# EasyEDA Pro project AFE-30P.epro, board PCB1_1
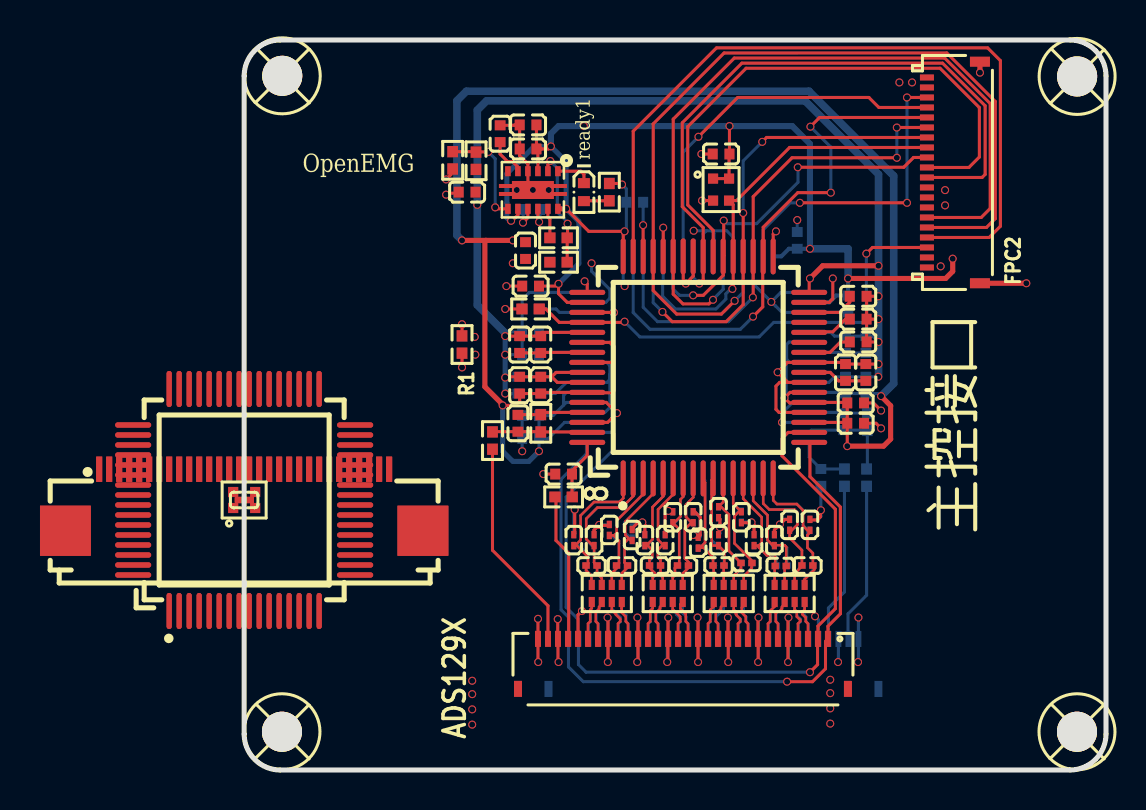
[diagram p0: board, top side]
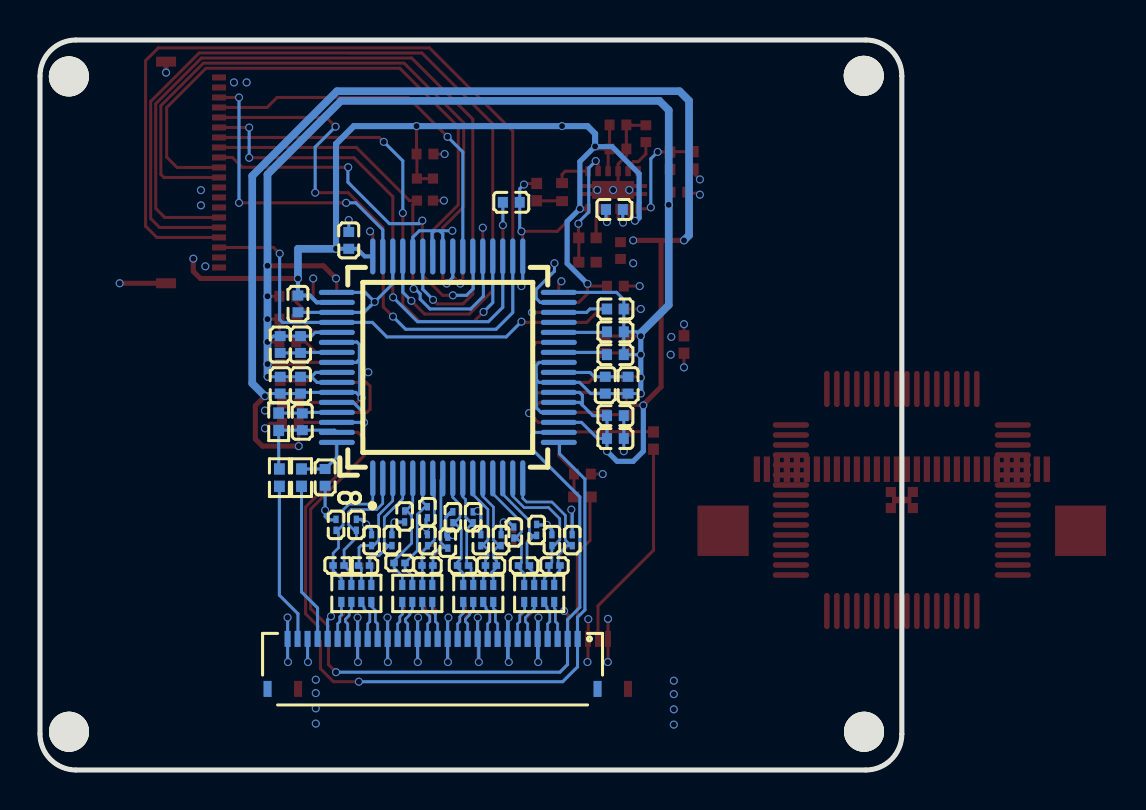
[diagram p1: board, bottom side, seen from below]

Outline 43.1 x 36.5 mm; copper layers: Top Layer, Inner1, Inner2, Bottom Layer. Coordinates in mm from the lower left corner of the outline.
Outline path: 0,34.7 0,1.8 arc(0.53,0.53) 1.8,0 41.3,0 arc(42.57,0.53) 43.1,1.8 43.1,34.7 arc(42.57,35.97) 41.3,36.5 1.8,36.5 arc(0.53,35.97) 0,34.7
Stack: Top Layer 0.035mm Outer layer thickness 1oz / Dielectric1 0.1mm 3313 RC57% 4.0mil / Inner1 0.0152mm Inner layer thickness / Dielectric2 0.5mm 0.5mm H/HOZ Copper / Inner2 0.0152mm Inner layer thickness / Dielectric3 0.1mm 3313 RC57% 4.0mil / Bottom Layer 0.035mm Outer layer thickness 1oz

## Design rules (mm)
net IN8N: DP1
net IN8P: DP1
net IN7N: DP2
net IN7P: DP2
net IN6N: DP3
net IN6P: DP3
net IN5N: DP4
net IN5P: DP4
net IN4N: DP5
net IN4P: DP5
net IN3N: DP6
net IN3P: DP6
net IN2P: DP7
net IN2N: DP7
net IN1N: DP8
net IN1P: DP8
net IN1P2: DP35
net IN1N2: DP35
net IN2P2: DP37
net IN2N2: DP37
net IN3P2: DP33
net IN3N2: DP33
net IN4P2: DP31
net IN4N2: DP31
net IN5P2: DP29
net IN5N2: DP29
net IN6P2: DP27
net IN6N2: DP27
net IN7P2: DP25
net IN7N2: DP25
net IN8P2: DP23
net IN8N2: DP23
spacing copperThickness1oz (default): track to track 0.102, other pairs 0.152 to 0.3
spacing copperThickness2oz: track to track 0.203, other pairs 0.152 to 0.3
spacing Copper_copperRegion: track to track 0.102, other pairs 0.152 to 0.3
spacing Plane_innerPlane: track to track 0.102, other pairs 0.152 to 0.3
track width copperThickness1oz (default): min 0.127, default 0.152, max 2.54
track width copperThickness2oz: min 0.203, default 0.254, max 2.54
differential pair differentialPair (default): width min 0.127, default 0.127, max 2.54; gap min 0.152, default 0.152
net +3.3V uses copperRegion_copperThickness1oz
net AGND uses copperRegion_copperThickness1oz
net -2.5V uses copperRegion_copperThickness1oz
net +2.5V uses copperRegion_copperThickness1oz
net GND uses copperRegion_copperThickness1oz
pour e1164 uses Copper_copperRegion, copperRegion_Copper_copperRegion
pour e1166 uses Copper_copperRegion, copperRegion_Copper_copperRegion
pour e1169 uses Copper_copperRegion, copperRegion_Copper_copperRegion
pour e1171 uses Copper_copperRegion, copperRegion_Copper_copperRegion
pour e1173 uses Copper_copperRegion, copperRegion_Copper_copperRegion
pour e1175 uses Copper_copperRegion, copperRegion_Copper_copperRegion
pour e1177 uses Copper_copperRegion, copperRegion_Copper_copperRegion
pour e1179 uses Copper_copperRegion, copperRegion_Copper_copperRegion
pour e1181 uses Copper_copperRegion, copperRegion_Copper_copperRegion
pour e1678 uses Copper_copperRegion, copperRegion_Copper_copperRegion
pour e1686 uses Copper_copperRegion, copperRegion_Copper_copperRegion
pour e1905 uses Copper_copperRegion, copperRegion_Copper_copperRegion
pour e1908 uses Copper_copperRegion, copperRegion_Copper_copperRegion
pour e1930 uses Copper_copperRegion, copperRegion_Copper_copperRegion

## Placement (name value [footprint] x y rotation side)
C1  22uF  [C0402]  30.71 22.54 0 top
C2  22uF  [C0402]  14.32 21.91 180 bottom
C3  100nF  [C0402]  31.09 19.88 270 top
C4  10uF  [C0402]  30.07 19.88 270 top
C5  100nF  [C0402]  13.69 19.24 90 bottom
C6  2.2uF  [C0402]  14.07 25.97 270 top
C7  2.2uF  [C0402]  11.15 28.89 180 top
C8  100nF  [C0402]  14.2 32.25 0 top
C9  10uF  [C0402]  14.2 31.05 180 top
C10  1uF  [C0402]  14.38 28.03 180 bottom
C11  4.7uF  [C0402]  12.8 31.81 270 top
C12  1uF  [C0402]  30.71 21.4 0 top
C13  1uF  [C0402]  30.71 23.69 0 top
C14  10nF  [C0402]  13.69 17.34 270 top
C15  1uF  [C0402]  14.32 20.77 180 bottom
C16  1uF  [C0402]  14.32 23.05 180 bottom
C17  10nF  [C0402]  29.98 17.41 270 bottom
C18  100nF  [C0402]  30.07 21.27 270 bottom
C19  1uF  [C0402]  31.09 21.27 270 bottom
C20  1uF  [C0402]  13.78 21.27 270 top
C21  100nF  [C0402]  14.83 21.27 270 top
C22  100nF  [C0402]  14.32 24.19 180 top
C23  1uF  [C0402]  19.53 28.39 0 bottom
C24  100nF  [C0402]  30.58 17.34 0 top
C25  1uF  [C0402]  30.58 18.35 0 top
C26  100nF  [C0402]  14.83 19.24 90 top
C27  1uF  [C0402]  13.78 19.24 90 top
C28  100nF  [C0402]  27.66 26.48 90 bottom
C29  1uF  [C0402]  30.2 23.31 270 bottom
C30  100nF  [C0402]  14.32 16.57 180 bottom
C31  1uF  [C0402]  14.32 17.72 180 bottom
C32  100nF  [C0402]  30.07 19.24 90 bottom
C33  1uF  [C0402]  31.09 19.24 90 bottom
C34  10uF  [C0402]  14.83 19.24 90 bottom
C37  100nF  [C0402]  23.85 30.8 0 top
C55  470pF  [C0201]  28.29 12.26 270 top
C57  470pF  [C0201]  27.28 12.26 270 top
C58  470pF  [C0201]  26.52 11.49 270 top
C59  470pF  [C0201]  25.5 11.49 270 top
C60  470pF  [C0201]  24.87 12.64 90 top
C61  470pF  [C0201]  23.72 12.89 90 top
C62  470pF  [C0201]  23.72 11.49 270 top
C63  470pF  [C0201]  22.71 11.37 270 top
C64  470pF  [C0201]  22.45 12.64 270 top
C65  470pF  [C0201]  21.44 12.64 270 top
C66  470pF  [C0201]  21.06 11.49 270 top
C67  470pF  [C0201]  20.04 11.49 270 top
C68  470pF  [C0201]  19.4 11.75 270 top
C69  470pF  [C0201]  18.26 12 270 top
C70  470pF  [C0201]  17.5 11.49 270 top
C71  470pF  [C0201]  16.48 11.49 270 top
C72  22pF  [C0201#2]  28.17 10.22 0 top
C73  22pF  [C0201#2]  26.83 10.2 0 top
C74  22pF  [C0201#2]  25.12 10.35 0 top
C75  22pF  [C0201#2]  23.72 10.22 0 top
C76  22pF  [C0201#2]  21.94 10.22 0 top
C77  22pF  [C0201#2]  20.55 10.22 0 top
C78  22pF  [C0201#2]  18.9 10.22 0 top
C79  22pF  [C0201#2]  17.37 10.22 0 top
C93  470pF  [C0201]  16.48 11.49 270 bottom
C94  470pF  [C0201]  17.5 11.49 270 bottom
C95  470pF  [C0201]  18.26 12 270 bottom
C96  470pF  [C0201]  19.4 11.88 270 bottom
C97  470pF  [C0201]  20.04 11.49 270 bottom
C98  470pF  [C0201]  21.06 11.49 270 bottom
C99  470pF  [C0201]  21.44 12.64 270 bottom
C100  470pF  [C0201]  22.45 12.64 270 bottom
C101  470pF  [C0201]  22.71 11.37 270 bottom
C102  470pF  [C0201]  23.72 11.49 270 bottom
C103  470pF  [C0201]  23.72 12.89 90 bottom
C104  470pF  [C0201]  24.87 12.68 90 bottom
C105  470pF  [C0201]  25.5 11.49 270 bottom
C106  470pF  [C0201]  26.52 11.49 270 bottom
C107  470pF  [C0201]  27.28 12.26 270 bottom
C108  470pF  [C0201]  28.29 12.26 270 bottom
C109  22pF  [C0201#2]  17.37 10.22 180 bottom
C110  22pF  [C0201#2]  18.9 10.22 180 bottom
C111  22pF  [C0201#2]  20.55 10.22 180 bottom
C112  22pF  [C0201#2]  21.94 10.22 180 bottom
C113  22pF  [C0201#2]  23.72 10.22 180 bottom
C114  22pF  [C0201#2]  25.12 10.35 180 bottom
C115  22pF  [C0201#2]  26.9 10.22 180 bottom
C116  22pF  [C0201#2]  28.17 10.22 180 bottom
C123  100pF  [C0402]  15.98 14.8 180 top
C124  100pF  [C0402]  28.84 14.63 270 bottom
FPC1  FH34SRJ-30S-0.5SH(50)  [FPC-SMD_30P-P0.50_XUNPU_FPC-05F-30PH20]  21.94 5.31 0 top
FPC2  5034802000  [FPC-SMD_5034802000]  35.47 29.88 90 top
FPC3  FH34SRJ-30S-0.5SH(50)  [FPC-SMD_30P-P0.50_XUNPU_FPC-05F-30PH20]  23.47 5.31 180 bottom
LM1  LM27762DSSR  [WSON-12_L3.0-W2.0-P0.50-BL-EP]  14.44 29 180 top
NOREF  -  [Pad_e190]  5.55 12.75 0 top
NOREF#2  -  [Pad_e171]  -0.75 19.05 0 top
NOREF#3  -  [Pad_e186]  5.55 14.75 0 top
NOREF#4  -  [Pad_e83]  -7.25 15.04 0 top
NOREF#5  -  [Pad_e22]  -0.27 13.5 0 top
NOREF#6  -  [Pad_e18]  -0.55 13.9 0 top
NOREF#7  -  [Pad_e196]  5.55 9.75 0 top
NOREF#8  -  [Pad_e155]  -5.55 12.75 0 top
NOREF#9  -  [Pad_e162]  -5.55 16.25 0 top
NOREF#10  -  [Pad_e66]  1.25 15.04 0 top
NOREF#11  -  [Pad_e59]  4.75 15.04 0 top
NOREF#12  -  [Pad_e77]  -4.25 15.04 0 top
NOREF#13  -  [Pad_e22]  -0.27 13.5 0 top
NOREF#14  -  [Pad_e82]  -6.75 15.04 0 top
NOREF#15  -  [Pad_e57]  5.75 15.04 0 top
NOREF#16  -  [Pad_e172]  -0.25 19.05 0 top
NOREF#17  -  [Pad_e75]  -3.25 15.04 0 top
NOREF#18  -  [Pad_e64]  2.25 15.04 0 top
NOREF#19  -  [Pad_e21]  0.27 13.5 0 top
NOREF#20  -  [Pad_e21]  0.27 13.5 0 top
NOREF#21  -  [Pad_e21]  0.27 13.5 0 top
NOREF#22  -  [Pad_e159]  -5.55 14.75 0 top
NOREF#23  -  [Pad_e182]  5.55 16.75 0 top
NOREF#24  -  [Pad_e21]  0.27 13.5 0 top
NOREF#25  -  [Pad_e156]  -5.55 13.25 0 top
NOREF#26  -  [Pad_e21]  0.27 13.5 0 top
NOREF#27  -  [Pad_e72]  -1.75 15.04 0 top
NOREF#28  -  [Pad_e205]  -0.25 7.95 0 top
NOREF#29  -  [Pad_e188]  5.55 13.75 0 top
NOREF#30  -  [Pad_e22]  -0.27 13.5 0 top
NOREF#31  -  [Pad_e78]  -4.75 15.04 0 top
NOREF#32  -  [Pad_e80]  -5.75 15.04 0 top
NOREF#33  -  [Pad_e81]  -6.25 15.04 0 top
NOREF#34  -  [Pad_e205]  -0.25 7.95 0 top
NOREF#35  -  [Pad_e22]  -0.27 13.5 0 top
NOREF#36  -  [Pad_e192]  5.55 11.75 0 top
NOREF#37  -  [Pad_e168]  -2.25 19.05 0 top
NOREF#38  -  [Pad_e207]  -1.25 7.95 0 top
NOREF#39  -  [Pad_e21]  0.27 13.5 0 top
NOREF#40  -  [Pad_e21]  0.27 13.5 0 top
NOREF#41  -  [Pad_e21]  0.27 13.5 0 top
NOREF#42  -  [Pad_e21]  0.27 13.5 0 top
NOREF#43  -  [Pad_e160]  -5.55 15.25 0 top
NOREF#44  -  [Pad_e21]  0.27 13.5 0 top
NOREF#45  -  [Pad_e22]  -0.27 13.5 0 top
NOREF#46  -  [Pad_e21]  0.27 13.5 0 top
NOREF#47  -  [Pad_e197]  3.75 7.95 0 top
NOREF#48  -  [Pad_e22]  -0.27 13.5 0 top
NOREF#49  -  [Pad_e208]  -1.75 7.95 0 top
NOREF#50  -  [Pad_e174]  0.75 19.05 0 top
NOREF#51  -  [Pad_e67]  0.75 15.04 0 top
NOREF#52  -  [Pad_e22]  -0.27 13.5 0 top
NOREF#53  -  [Pad_e81]  -6.25 15.04 0 top
NOREF#54  -  [Pad_e68]  0.25 15.04 0 top
NOREF#55  -  [Pad_e21]  0.27 13.5 0 top
NOREF#56  -  [Pad_e22]  -0.27 13.5 0 top
NOREF#57  -  [Pad_e184]  5.55 15.75 0 top
NOREF#58  -  [Pad_e77]  -4.25 15.04 0 top
NOREF#59  -  [Pad_e21]  0.27 13.5 0 top
NOREF#60  -  [Pad_e173]  0.25 19.05 0 top
NOREF#61  -  [Pad_e209]  -2.25 7.95 0 top
NOREF#62  -  [Pad_e21]  0.27 13.5 0 top
NOREF#63  -  [Pad_e22]  -0.27 13.5 0 top
NOREF#64  -  [Pad_e160]  -5.55 15.25 0 top
NOREF#65  -  [Pad_e70]  -0.75 15.04 0 top
NOREF#66  -  [Pad_e191]  5.55 12.25 0 top
NOREF#67  -  [Pad_e22]  -0.27 13.5 0 top
NOREF#68  -  [Pad_e22]  -0.27 13.5 0 top
NOREF#69  -  [Pad_e207]  -1.25 7.95 0 top
NOREF#70  -  [Pad_e210]  -2.75 7.95 0 top
NOREF#71  -  [Pad_e22]  -0.27 13.5 0 top
NOREF#72  -  [Pad_e177]  2.25 19.05 0 top
NOREF#73  -  [Pad_e21]  0.27 13.5 0 top
NOREF#74  -  [Pad_e198]  3.25 7.95 0 top
NOREF#75  -  [Pad_e176]  1.75 19.05 0 top
NOREF#76  -  [Pad_e183]  5.55 16.25 0 top
NOREF#77  -  [Pad_e80]  -5.75 15.04 0 top
NOREF#78  -  [Pad_e185]  5.55 15.25 0 top
NOREF#79  -  [Pad_e194]  5.55 10.75 0 top
NOREF#80  -  [Pad_e189]  5.55 13.25 0 top
NOREF#81  -  [Pad_e22]  -0.27 13.5 0 top
NOREF#82  -  [Pad_e63]  2.75 15.04 0 top
NOREF#83  -  [Pad_e170]  -1.25 19.05 0 top
NOREF#84  -  [Pad_e55]  6.75 15.04 0 top
NOREF#85  -  [Pad_e167]  -2.75 19.05 0 top
NOREF#86  -  [Pad_e172]  -0.25 19.05 0 top
NOREF#87  -  [Pad_e79]  -5.25 15.04 0 top
NOREF#88  -  [Pad_e162]  -5.55 16.25 0 top
NOREF#89  -  [Pad_e21]  0.27 13.5 0 top
NOREF#90  -  [Pad_e167]  -2.75 19.05 0 top
NOREF#91  -  [Pad_e22]  -0.27 13.5 0 top
NOREF#92  -  [Pad_e166]  -3.25 19.05 0 top
NOREF#93  -  [Pad_e21]  0.27 13.5 0 top
NOREF#94  -  [Pad_e54]  7.25 15.04 0 top
NOREF#95  -  [Pad_e63]  2.75 15.04 0 top
NOREF#96  -  [Pad_e156]  -5.55 13.25 0 top
NOREF#97  -  [Pad_e17]  0.55 13.9 0 top
NOREF#98  -  [Pad_e61]  3.75 15.04 0 top
NOREF#99  -  [Pad_e173]  0.25 19.05 0 top
NOREF#100  -  [Pad_e22]  -0.27 13.5 0 top
NOREF#101  -  [Pad_e73]  -2.25 15.04 0 top
NOREF#102  -  [Pad_e22]  -0.27 13.5 0 top
NOREF#103  -  [Pad_e195]  5.55 10.25 0 top
NOREF#104  -  [Pad_e210]  -2.75 7.95 0 top
NOREF#105  -  [Pad_e151]  -5.55 10.75 0 top
NOREF#106  -  [Pad_e72]  -1.75 15.04 0 top
NOREF#107  -  [Pad_e208]  -1.75 7.95 0 top
NOREF#108  -  [Pad_e61]  3.75 15.04 0 top
NOREF#109  -  [Pad_e22]  -0.27 13.5 0 top
NOREF#110  -  [Pad_e21]  0.27 13.5 0 top
NOREF#111  -  [Pad_e21]  0.27 13.5 0 top
NOREF#112  -  [Pad_e153]  -5.55 11.75 0 top
NOREF#113  -  [Pad_e194]  5.55 10.75 0 top
NOREF#114  -  [Pad_e179]  3.25 19.05 0 top
NOREF#115  -  [Pad_e60]  4.25 15.04 0 top
NOREF#116  -  [Pad_e187]  5.55 14.25 0 top
NOREF#117  -  [Pad_e69]  -0.25 15.04 0 top
NOREF#118  -  [Pad_e197]  3.75 7.95 0 top
NOREF#119  -  [Pad_e65]  1.75 15.04 0 top
NOREF#120  -  [Pad_e21]  0.27 13.5 0 top
NOREF#121  -  [Pad_e22]  -0.27 13.5 0 top
NOREF#122  -  [Pad_e202]  1.25 7.95 0 top
NOREF#123  -  [Pad_e203]  0.75 7.95 0 top
NOREF#124  -  [Pad_e69]  -0.25 15.04 0 top
NOREF#125  -  [Pad_e212]  -3.75 7.95 0 top
NOREF#126  -  [Pad_e164]  -5.55 17.25 0 top
NOREF#127  -  [Pad_e21]  0.27 13.5 0 top
NOREF#128  -  [Pad_e74]  -2.75 15.04 0 top
NOREF#129  -  [Pad_e22]  -0.27 13.5 0 top
NOREF#130  -  [Pad_e57]  5.75 15.04 0 top
NOREF#131  -  [Pad_e22]  -0.27 13.5 0 top
NOREF#132  -  [Pad_e202]  1.25 7.95 0 top
NOREF#133  -  [Pad_e175]  1.25 19.05 0 top
NOREF#134  -  [Pad_e171]  -0.75 19.05 0 top
NOREF#135  -  [Pad_e204]  0.25 7.95 0 top
NOREF#136  -  [Pad_e21]  0.27 13.5 0 top
NOREF#137  -  [Pad_e159]  -5.55 14.75 0 top
NOREF#138  -  [Pad_e54]  7.25 15.04 0 top
NOREF#139  -  [Pad_e200]  2.25 7.95 0 top
NOREF#140  -  [Pad_e21]  0.27 13.5 0 top
NOREF#141  -  [Pad_e196]  5.55 9.75 0 top
NOREF#142  -  [Pad_e22]  -0.27 13.5 0 top
NOREF#143  -  [Pad_e21]  0.27 13.5 0 top
NOREF#144  -  [Pad_e59]  4.75 15.04 0 top
NOREF#145  -  [Pad_e192]  5.55 11.75 0 top
NOREF#146  -  [Pad_e201]  1.75 7.95 0 top
NOREF#147  -  [Pad_e190]  5.55 12.75 0 top
NOREF#148  -  [Pad_e199]  2.75 7.95 0 top
NOREF#149  -  [Pad_e70]  -0.75 15.04 0 top
NOREF#150  -  [Pad_e60]  4.25 15.04 0 top
NOREF#151  -  [Pad_e181]  5.55 17.25 0 top
NOREF#152  -  [Pad_e184]  5.55 15.75 0 top
NOREF#153  -  [Pad_e161]  -5.55 15.75 0 top
NOREF#154  -  [Pad_e56]  6.25 15.04 0 top
NOREF#155  -  [Pad_e66]  1.25 15.04 0 top
NOREF#156  -  [Pad_e74]  -2.75 15.04 0 top
NOREF#157  -  [Pad_e175]  1.25 19.05 0 top
NOREF#158  -  [Pad_e67]  0.75 15.04 0 top
NOREF#159  -  [Pad_e158]  -5.55 14.25 0 top
NOREF#160  -  [Pad_e212]  -3.75 7.95 0 top
NOREF#161  -  [Pad_e56]  6.25 15.04 0 top
NOREF#162  -  [Pad_e58]  5.25 15.04 0 top
NOREF#163  -  [Pad_e22]  -0.27 13.5 0 top
NOREF#164  -  [Pad_e183]  5.55 16.25 0 top
NOREF#165  -  [Pad_e151]  -5.55 10.75 0 top
NOREF#166  -  [Pad_e21]  0.27 13.5 0 top
NOREF#167  -  [Pad_e180]  3.75 19.05 0 top
NOREF#168  -  [Pad_e174]  0.75 19.05 0 top
NOREF#169  -  [Pad_e55]  6.75 15.04 0 top
NOREF#170  -  [Pad_e155]  -5.55 12.75 0 top
NOREF#171  -  [Pad_e76]  -3.75 15.04 0 top
NOREF#172  -  [Pad_e52]  8.94 11.96 0 top
NOREF#173  -  [Pad_e168]  -2.25 19.05 0 top
NOREF#174  -  [Pad_e71]  -1.25 15.04 0 top
NOREF#175  -  [Pad_e201]  1.75 7.95 0 top
NOREF#176  -  [Pad_e68]  0.25 15.04 0 top
NOREF#177  -  [Pad_e75]  -3.25 15.04 0 top
NOREF#178  -  [Pad_e195]  5.55 10.25 0 top
NOREF#179  -  [Pad_e186]  5.55 14.75 0 top
NOREF#180  -  [Pad_e177]  2.25 19.05 0 top
NOREF#181  -  [Pad_e58]  5.25 15.04 0 top
NOREF#182  -  [Pad_e157]  -5.55 13.75 0 top
NOREF#183  -  [Pad_e76]  -3.75 15.04 0 top
NOREF#184  -  [Pad_e163]  -5.55 16.75 0 top
NOREF#185  -  [Pad_e82]  -6.75 15.04 0 top
NOREF#186  -  [Pad_e152]  -5.55 11.25 0 top
NOREF#187  -  [Pad_e185]  5.55 15.25 0 top
NOREF#188  -  [Pad_e62]  3.25 15.04 0 top
NOREF#189  -  [Pad_e22]  -0.27 13.5 0 top
NOREF#190  -  [Pad_e193]  5.55 11.25 0 top
NOREF#191  -  [Pad_e199]  2.75 7.95 0 top
NOREF#192  -  [Pad_e21]  0.27 13.5 0 top
NOREF#193  -  [Pad_e16]  0.55 13.1 0 top
NOREF#194  -  [Pad_e15]  -0.55 13.1 0 top
NOREF#195  -  [Pad_e152]  -5.55 11.25 0 top
NOREF#196  -  [Pad_e203]  0.75 7.95 0 top
NOREF#197  -  [Pad_e169]  -1.75 19.05 0 top
NOREF#198  -  [Pad_e21]  0.27 13.5 0 top
NOREF#199  -  [Pad_e188]  5.55 13.75 0 top
NOREF#200  -  [Pad_e209]  -2.25 7.95 0 top
NOREF#201  -  [Pad_e65]  1.75 15.04 0 top
NOREF#202  -  [Pad_e150]  -5.55 10.25 0 top
NOREF#203  -  [Pad_e206]  -0.75 7.95 0 top
NOREF#204  -  [Pad_e170]  -1.25 19.05 0 top
NOREF#205  -  [Pad_e166]  -3.25 19.05 0 top
NOREF#206  -  [Pad_e21]  0.27 13.5 0 top
NOREF#207  -  [Pad_e22]  -0.27 13.5 0 top
NOREF#208  -  [Pad_e163]  -5.55 16.75 0 top
NOREF#209  -  [Pad_e153]  -5.55 11.75 0 top
NOREF#210  -  [Pad_e211]  -3.25 7.95 0 top
NOREF#211  -  [Pad_e189]  5.55 13.25 0 top
NOREF#212  -  [Pad_e83]  -7.25 15.04 0 top
NOREF#213  -  [Pad_e169]  -1.75 19.05 0 top
NOREF#214  -  [Pad_e157]  -5.55 13.75 0 top
NOREF#215  -  [Pad_e158]  -5.55 14.25 0 top
NOREF#216  -  [Pad_e176]  1.75 19.05 0 top
NOREF#217  -  [Pad_e178]  2.75 19.05 0 top
NOREF#218  -  [Pad_e200]  2.25 7.95 0 top
NOREF#219  -  [Pad_e22]  -0.27 13.5 0 top
NOREF#220  -  [Pad_e21]  0.27 13.5 0 top
NOREF#221  -  [Pad_e73]  -2.25 15.04 0 top
NOREF#222  -  [Pad_e71]  -1.25 15.04 0 top
NOREF#223  -  [Pad_e211]  -3.25 7.95 0 top
NOREF#224  -  [Pad_e165]  -3.75 19.05 0 top
NOREF#225  -  [Pad_e204]  0.25 7.95 0 top
NOREF#226  -  [Pad_e22]  -0.27 13.5 0 top
NOREF#227  -  [Pad_e161]  -5.55 15.75 0 top
NOREF#228  -  [Pad_e53]  -8.94 11.96 0 top
NOREF#229  -  [Pad_e22]  -0.27 13.5 0 top
NOREF#230  -  [Pad_e149]  -5.55 9.75 0 top
NOREF#231  -  [Pad_e150]  -5.55 10.25 0 top
NOREF#232  -  [Pad_e165]  -3.75 19.05 0 top
NOREF#233  -  [Pad_e62]  3.25 15.04 0 top
NOREF#234  -  [Pad_e154]  -5.55 12.25 0 top
NOREF#235  -  [Pad_e21]  0.27 13.5 0 top
NOREF#236  -  [Pad_e187]  5.55 14.25 0 top
NOREF#237  -  [Pad_e52]  8.94 11.96 0 top
NOREF#238  -  [Pad_e198]  3.25 7.95 0 top
NOREF#239  -  [Pad_e53]  -8.94 11.96 0 top
NOREF#240  -  [Pad_e191]  5.55 12.25 0 top
NOREF#241  -  [Pad_e193]  5.55 11.25 0 top
NOREF#242  -  [Pad_e206]  -0.75 7.95 0 top
NOREF#243  -  [Pad_e154]  -5.55 12.25 0 top
NOREF#244  -  [Pad_e78]  -4.75 15.04 0 top
NOREF#245  -  [Pad_e21]  0.27 13.5 0 top
NOREF#246  -  [Pad_e64]  2.25 15.04 0 top
NOREF#247  -  [Pad_e22]  -0.27 13.5 0 top
NOREF#248  -  [Pad_e22]  -0.27 13.5 0 top
NOREF#249  -  [Pad_e181]  5.55 17.25 0 top
NOREF#250  -  [Pad_e21]  0.27 13.5 0 top
NOREF#251  -  [Pad_e180]  3.75 19.05 0 top
NOREF#252  -  [Pad_e179]  3.25 19.05 0 top
NOREF#253  -  [Pad_e182]  5.55 16.75 0 top
NOREF#254  -  [Pad_e149]  -5.55 9.75 0 top
NOREF#255  -  [Pad_e178]  2.75 19.05 0 top
NOREF#256  -  [Pad_e79]  -5.25 15.04 0 top
NOREF#257  -  [Pad_e22]  -0.27 13.5 0 top
NOREF#258  -  [Pad_e22]  -0.27 13.5 0 top
NOREF#259  -  [Pad_e22]  -0.27 13.5 0 top
NOREF#260  -  [Pad_e164]  -5.55 17.25 0 top
NOREF#261  -  [Pad_e21]  0.27 13.5 0 top
NOREF#262  -  [Pad_e22]  -0.27 13.5 0 top
R1  0Ω  [R0402]  10.9 21.27 90 top
R3  100kΩ  [R0402]  15.72 25.39 0 top
R4  105kΩ  [R0402]  11.6 30.46 270 top
R5  100kΩ  [R0402]  10.43 30.48 90 top
R6  107kΩ  [R0402]  15.72 26.61 180 top
R17  10kΩ  [R0402]  14.32 23.05 0 top
R24  392kΩ  [R0402]  14.83 17.34 270 top
R32  392kΩ  [R0402]  31.16 17.41 270 bottom
R34  392kΩ  [R0402]  12.42 16.47 270 top
R35  10kΩ  [R0402]  15.98 13.65 180 top
R36  392kΩ  [R0402]  31.13 14.62 270 bottom
R37  10kΩ  [R0402]  30.02 14.62 270 bottom
R_pu1  10kΩ  [R0402]  18.26 28.89 270 top
ready1  XL-1005UGC  [LED0402-RD_GREEN-1]  16.99 28.89 270 top
SCREW1  -  [M2螺丝]  1.91 34.71 0 top
SCREW2  -  [M2螺丝]  1.89 1.91 0 top
SCREW3  -  [M2螺丝]  41.65 1.91 0 top
SCREW4  -  [M2螺丝]  41.66 34.68 0 top
U1  ADS1298IPAGR  [TQFP-64_L10.0-W10.0-P0.50-LS12.0-BL]  22.71 20.13 0 top
U2  ADS1298IPAGR  [TQFP-64_L10.0-W10.0-P0.50-LS12.0-BL]  22.71 20.13 180 bottom
U3  15kΩ  [RES-ARRAY-SMD_0402-8P-L2.0-W1.0-BL]  18.13 8.83 180 top
U4  15kΩ  [RES-ARRAY-SMD_0402-8P-L2.0-W1.0-BL]  21.18 8.83 180 top
U5  15kΩ  [RES-ARRAY-SMD_0402-8P-L2.0-W1.0-BL]  24.23 8.83 180 top
U6  15kΩ  [RES-ARRAY-SMD_0402-8P-L2.0-W1.0-BL]  27.28 8.83 180 top
U7  15kΩ  [RES-ARRAY-SMD_0402-8P-L2.0-W1.0-BL]  27.28 8.83 0 bottom
U8  15kΩ  [RES-ARRAY-SMD_0402-8P-L2.0-W1.0-BL]  24.23 8.83 0 bottom
U9  15kΩ  [RES-ARRAY-SMD_0402-8P-L2.0-W1.0-BL]  21.18 8.83 0 bottom
U10  15kΩ  [RES-ARRAY-SMD_0402-8P-L2.0-W1.0-BL]  18.13 8.83 0 bottom
X1  2.048MHz  [OSC-SMD_4P-L1.6-W1.2-BL]  23.85 29.02 270 top

## Footprints (pads in the part's own frame, mm; a bottom-side part is the same pattern mirrored in y, then rotated)
C0201
  rect 0.368x0.254 smd: 1(-0.275,0) 2(0.275,0)
C0201#2
  rect 0.368x0.325 smd: 1(-0.275,0) 2(0.275,0)
C0402
  rect 0.5x0.54 smd: 1(-0.42,0) 2(0.42,0)
FPC-SMD_30P-P0.50_XUNPU_FPC-05F-30PH20
  rect 0.3x0.8 smd: 1(7.25,1.25) 2(6.75,1.25) 3(6.25,1.25) 4(5.75,1.25) 5(5.25,1.25) 6(4.75,1.25) 7(4.25,1.25) 8(3.75,1.25) 9(3.25,1.25) 10(2.75,1.25) 11(2.25,1.25) 12(1.75,1.25) 13(1.25,1.25) 14(0.75,1.25) 15(0.25,1.25) 16(-0.25,1.25) 17(-0.75,1.25) 18(-1.25,1.25) 19(-1.75,1.25) 20(-2.25,1.25) 21(-2.75,1.25) 22(-3.25,1.25) 23(-3.75,1.25) 24(-4.25,1.25) 25(-4.75,1.25) 26(-5.25,1.25) 27(-5.75,1.25) 28(-6.25,1.25) 29(-6.75,1.25) 30(-7.25,1.25)
  rect 0.4x0.8 smd: 31(-8.25,-1.25) 32(8.25,-1.25)
FPC-SMD_5034802000
  rect 0.3x0.7 smd: 1(-4.75,1.325) 2(-4.25,1.325) 3(-3.75,1.325) 4(-3.25,1.325) 5(-2.75,1.325) 6(-2.25,1.325) 7(-1.75,1.325) 8(-1.25,1.325) 9(-0.75,1.325) 10(-0.25,1.325) 11(0.25,1.325) 12(0.75,1.325) 13(1.25,1.325) 14(1.75,1.325) 15(2.25,1.325) 16(2.75,1.325) 17(3.25,1.325) 18(3.75,1.325) 19(4.25,1.325) 20(4.75,1.325)
  rect 0.5x1 smd: 21(5.54,-1.325) 22(-5.54,-1.325)
LED0402-RD_GREEN-1
  rect 0.5x0.6 smd: 1(-0.45,0) 2(0.45,0)
M2螺丝
  round 2 hole 2: 1(0,0)
OSC-SMD_4P-L1.6-W1.2-BL
  rect 0.508x0.508 smd: 1(-0.55,-0.4) 2(0.55,-0.4) 3(0.55,0.4) 4(-0.55,0.4)
Pad_e15
  rect 0.508x0.508 smd: 1(0,0)
Pad_e16
  rect 0.508x0.508 smd: 2(0,0)
Pad_e17
  rect 0.508x0.508 smd: 3(0,0)
Pad_e18
  rect 0.508x0.508 smd: 4(0,0)
Pad_e21
  rect 0.368x0.254 smd: 2(0,0)
Pad_e22
  rect 0.368x0.254 smd: 1(0,0)
Pad_e52
  rect 2.54x2.5 smd: 31(0,0)
Pad_e53
  rect 2.54x2.5 smd: 32(0,0)
Pad_e54
  rect 0.299x1.27 smd: 30(0,0)
Pad_e55
  rect 0.299x1.27 smd: 29(0,0)
Pad_e56
  rect 0.299x1.25 smd: 28(0,0)
Pad_e57
  rect 0.299x1.27 smd: 27(0,0)
Pad_e58
  rect 0.299x1.27 smd: 26(0,0)
Pad_e59
  rect 0.299x1.25 smd: 25(0,0)
Pad_e60
  rect 0.299x1.27 smd: 24(0,0)
Pad_e61
  rect 0.299x1.27 smd: 23(0,0)
Pad_e62
  rect 0.299x1.27 smd: 22(0,0)
Pad_e63
  rect 0.299x1.25 smd: 21(0,0)
Pad_e64
  rect 0.299x1.27 smd: 20(0,0)
Pad_e65
  rect 0.299x1.27 smd: 19(0,0)
Pad_e66
  rect 0.299x1.25 smd: 18(0,0)
Pad_e67
  rect 0.299x1.27 smd: 17(0,0)
Pad_e68
  rect 0.299x1.25 smd: 16(0,0)
Pad_e69
  rect 0.299x1.27 smd: 15(0,0)
Pad_e70
  rect 0.299x1.25 smd: 14(0,0)
Pad_e71
  rect 0.299x1.27 smd: 13(0,0)
Pad_e72
  rect 0.299x1.27 smd: 12(0,0)
Pad_e73
  rect 0.299x1.25 smd: 11(0,0)
Pad_e74
  rect 0.299x1.27 smd: 10(0,0)
Pad_e75
  rect 0.299x1.25 smd: 9(0,0)
Pad_e76
  rect 0.299x1.27 smd: 8(0,0)
Pad_e77
  rect 0.299x1.25 smd: 7(0,0)
Pad_e78
  rect 0.299x1.27 smd: 6(0,0)
Pad_e79
  rect 0.299x1.25 smd: 5(0,0)
Pad_e80
  rect 0.299x1.25 smd: 4(0,0)
Pad_e81
  rect 0.299x1.25 smd: 3(0,0)
Pad_e82
  rect 0.299x1.25 smd: 2(0,0)
Pad_e83
  rect 0.299x1.27 smd: 1(0,0)
Pad_e149
  oval 1.8x0.254 smd: 64(0,0)
Pad_e150
  oval 1.8x0.254 smd: 63(0,0)
Pad_e151
  oval 1.8x0.254 smd: 62(0,0)
Pad_e152
  oval 1.8x0.254 smd: 61(0,0)
Pad_e153
  oval 1.8x0.254 smd: 60(0,0)
Pad_e154
  oval 1.8x0.254 smd: 59(0,0)
Pad_e155
  oval 1.8x0.254 smd: 58(0,0)
Pad_e156
  oval 1.8x0.254 smd: 57(0,0)
Pad_e157
  oval 1.8x0.254 smd: 56(0,0)
Pad_e158
  oval 1.8x0.254 smd: 55(0,0)
Pad_e159
  oval 1.8x0.254 smd: 54(0,0)
Pad_e160
  oval 1.8x0.254 smd: 53(0,0)
Pad_e161
  oval 1.8x0.254 smd: 52(0,0)
Pad_e162
  oval 1.8x0.254 smd: 51(0,0)
Pad_e163
  oval 1.8x0.254 smd: 50(0,0)
Pad_e164
  oval 1.8x0.254 smd: 49(0,0)
Pad_e165
  oval 0.254x1.8 smd: 48(0,0)
Pad_e166
  oval 0.254x1.8 smd: 47(0,0)
Pad_e167
  oval 0.254x1.8 smd: 46(0,0)
Pad_e168
  oval 0.254x1.8 smd: 45(0,0)
Pad_e169
  oval 0.254x1.8 smd: 44(0,0)
Pad_e170
  oval 0.254x1.8 smd: 43(0,0)
Pad_e171
  oval 0.254x1.8 smd: 42(0,0)
Pad_e172
  oval 0.254x1.8 smd: 41(0,0)
Pad_e173
  oval 0.254x1.8 smd: 40(0,0)
Pad_e174
  oval 0.254x1.8 smd: 39(0,0)
Pad_e175
  oval 0.254x1.8 smd: 38(0,0)
Pad_e176
  oval 0.254x1.8 smd: 37(0,0)
Pad_e177
  oval 0.254x1.8 smd: 36(0,0)
Pad_e178
  oval 0.254x1.8 smd: 35(0,0)
Pad_e179
  oval 0.254x1.8 smd: 34(0,0)
Pad_e180
  oval 0.254x1.8 smd: 33(0,0)
Pad_e181
  oval 1.8x0.254 smd: 32(0,0)
Pad_e182
  oval 1.8x0.254 smd: 31(0,0)
Pad_e183
  oval 1.8x0.254 smd: 30(0,0)
Pad_e184
  oval 1.8x0.254 smd: 29(0,0)
Pad_e185
  oval 1.8x0.254 smd: 28(0,0)
Pad_e186
  oval 1.8x0.254 smd: 27(0,0)
Pad_e187
  oval 1.8x0.254 smd: 26(0,0)
Pad_e188
  oval 1.8x0.254 smd: 25(0,0)
Pad_e189
  oval 1.8x0.254 smd: 24(0,0)
Pad_e190
  oval 1.8x0.254 smd: 23(0,0)
Pad_e191
  oval 1.8x0.254 smd: 22(0,0)
Pad_e192
  oval 1.8x0.254 smd: 21(0,0)
Pad_e193
  oval 1.8x0.254 smd: 20(0,0)
Pad_e194
  oval 1.8x0.254 smd: 19(0,0)
Pad_e195
  oval 1.8x0.254 smd: 18(0,0)
Pad_e196
  oval 1.8x0.254 smd: 17(0,0)
Pad_e197
  oval 0.254x1.8 smd: 16(0,0)
Pad_e198
  oval 0.254x1.8 smd: 15(0,0)
Pad_e199
  oval 0.254x1.8 smd: 14(0,0)
Pad_e200
  oval 0.254x1.8 smd: 13(0,0)
Pad_e201
  oval 0.254x1.8 smd: 12(0,0)
Pad_e202
  oval 0.254x1.8 smd: 11(0,0)
Pad_e203
  oval 0.254x1.8 smd: 10(0,0)
Pad_e204
  oval 0.254x1.8 smd: 9(0,0)
Pad_e205
  oval 0.254x1.8 smd: 8(0,0)
Pad_e206
  oval 0.254x1.8 smd: 7(0,0)
Pad_e207
  oval 0.254x1.8 smd: 6(0,0)
Pad_e208
  oval 0.254x1.8 smd: 5(0,0)
Pad_e209
  oval 0.254x1.8 smd: 4(0,0)
Pad_e210
  oval 0.254x1.8 smd: 3(0,0)
Pad_e211
  oval 0.254x1.8 smd: 2(0,0)
Pad_e212
  oval 0.254x1.8 smd: 1(0,0)
R0402
  rect 0.566x0.54 smd: 1(-0.433,0) 2(0.433,0)
RES-ARRAY-SMD_0402-8P-L2.0-W1.0-BL
  rect 0.3x0.505 smd: 1(-0.75,0.427) 2(-0.25,0.427) 3(0.25,0.427) 4(0.75,0.427) 5(0.75,-0.427) 6(0.25,-0.427) 7(-0.25,-0.427) 8(-0.75,-0.427)
TQFP-64_L10.0-W10.0-P0.50-LS12.0-BL
  oval 0.254x1.8 smd: 1(-3.75,-5.55) 2(-3.25,-5.55) 3(-2.75,-5.55) 4(-2.25,-5.55) 5(-1.75,-5.55) 6(-1.25,-5.55) 7(-0.75,-5.55) 8(-0.25,-5.55) 9(0.25,-5.55) 10(0.75,-5.55) 11(1.25,-5.55) 12(1.75,-5.55) 13(2.25,-5.55) 14(2.75,-5.55) 15(3.25,-5.55) 16(3.75,-5.55) 33(3.75,5.55) 34(3.25,5.55) 35(2.75,5.55) 36(2.25,5.55) 37(1.75,5.55) 38(1.25,5.55) 39(0.75,5.55) 40(0.25,5.55) 41(-0.25,5.55) 42(-0.75,5.55) 43(-1.25,5.55) 44(-1.75,5.55) 45(-2.25,5.55) 46(-2.75,5.55) 47(-3.25,5.55) 48(-3.75,5.55)
  oval 1.8x0.254 smd: 17(5.55,-3.75) 18(5.55,-3.25) 19(5.55,-2.75) 20(5.55,-2.25) 21(5.55,-1.75) 22(5.55,-1.25) 23(5.55,-0.75) 24(5.55,-0.25) 25(5.55,0.25) 26(5.55,0.75) 27(5.55,1.25) 28(5.55,1.75) 29(5.55,2.25) 30(5.55,2.75) 31(5.55,3.25) 32(5.55,3.75) 49(-5.55,3.75) 50(-5.55,3.25) 51(-5.55,2.75) 52(-5.55,2.25) 53(-5.55,1.75) 54(-5.55,1.25) 55(-5.55,0.75) 56(-5.55,0.25) 57(-5.55,-0.25) 58(-5.55,-0.75) 59(-5.55,-1.25) 60(-5.55,-1.75) 61(-5.55,-2.25) 62(-5.55,-2.75) 63(-5.55,-3.25) 64(-5.55,-3.75)
WSON-12_L3.0-W2.0-P0.50-BL-EP
  rect 0.28x0.5 smd: 1(-1.25,-0.94) 2(-0.75,-0.94) 3(-0.25,-0.94) 4(0.25,-0.94) 5(0.75,-0.94) 6(1.25,-0.94) 7(1.25,0.94) 8(0.75,0.94) 9(0.25,0.94) 10(-0.25,0.94) 11(-0.75,0.94) 12(-1.25,0.94)
  custom 3.4x0.9 smd: 13(0,0)

## Nets
+2.5V: C6.1 C24.1 C25.1 C26.1 C27.1 C30.1 C31.1 C32.1 C33.1 LM1.11 R6.2 U1.19 U1.21 U1.22 U1.54 U1.56 U1.59 U2.19 U2.21 U2.22 U2.54 U2.56 U2.59
+3.3V: C8.2 C9.1 C22.1 C23.1 C28.1 C29.1 C37.2 FPC2.1 FPC2.2 LM1.3 LM1.8 LM1.12 R_pu1.1 U1.48 U1.50 U2.48 U2.50 X1.1 X1.4
-2.5V: C1.2 C2.2 C3.1 C4.1 C5.1 C7.1 C12.2 C13.2 C15.2 C16.2 C18.1 C19.1 C20.1 C21.1 C26.2 C27.2 C32.2 C33.2 C34.1 LM1.6 R4.2 U1.20 U1.23 U1.25 U1.32 U1.53 U1.57 U1.58 U2.20 U2.23 U2.25 U2.32 U2.53 U2.57 U2.58
AGND: C6.2 C7.2 C8.1 C9.2 C11.1 C24.2 C25.2 C30.2 C31.2 C55.1 C57.1 C58.1 C59.1 C60.1 C61.1 C62.1 C63.1 C64.1 C65.1 C66.1 C67.1 C68.1 C69.1 C70.1 C71.1 C93.1 C94.1 C95.1 C96.1 C97.1 C98.1 C99.1 C100.1 C101.1 C102.1 C103.1 C104.1 C105.1 C106.1 C107.1 C108.1 C123.2 C124.2 FPC1.5 FPC1.8 FPC1.11 FPC1.14 FPC1.17 FPC1.20 FPC1.23 FPC1.26 FPC1.28 FPC1.30 FPC1.31 FPC1.32 FPC3.5 FPC3.8 FPC3.11 FPC3.14 FPC3.17 FPC3.20 FPC3.23 FPC3.26 FPC3.28 FPC3.30 FPC3.31 FPC3.32 LM1.4 LM1.13 R1.1 R3.1 R5.1 U1.60 U1.62 U2.60 U2.62
GND: C22.2 C23.2 C28.2 C29.2 C37.1 FPC2.7 FPC2.8 FPC2.9 FPC2.19 FPC2.20 FPC2.21 FPC2.22 R1.2 R17.1 U1.31 U1.33 U1.41 U1.42 U1.44 U1.46 U1.49 U1.51 U2.31 U2.33 U2.41 U2.42 U2.44 U2.46 U2.49 U2.51 X1.2
BIAS_DRV1: FPC1.29 R34.2
BIAS_DRV12: FPC3.29 R36.2
BIASINV1: C14.1 R24.1 U1.61
BIASINV12: C17.1 R32.1 U2.61
BIASOUT1: C14.2 R24.2 R34.1 U1.63
BIASOUT12: C17.2 R32.2 R36.1 U2.63
CLK: FPC2.13 U1.37 U2.37 X1.3
CLKSEL: FPC2.3 R17.2 U1.52 U2.52
CS#: FPC2.11 U1.39
CS#2: FPC2.17 U2.39
DIN: FPC2.16 U1.34 U2.34
DOUT: FPC2.6 U1.43 U2.43
DRDY2#: FPC2.18 U2.47
DRDY#: FPC2.4 U1.47
FB: LM1.2 R3.2 R6.1
FB-: LM1.7 R4.1 R5.2
GPIO3: FPC2.5 U1.45 U2.45
IN1N: C57.2 C72.1 U1.15 U6.7
IN1N2: C94.2 C109.1 U2.15 U10.7
IN1P: C55.2 C72.2 U1.16 U6.8
IN1P2: C93.2 C109.2 U2.16 U10.8
IN2N: C59.2 C73.1 U1.13 U6.5
IN2N2: C96.2 C110.1 U2.13 U10.5
IN2P: C58.2 C73.2 U1.14 U6.6
IN2P2: C95.2 C110.2 U2.14 U10.6
IN3N: C61.2 C74.1 U1.11 U5.7
IN3N2: C98.2 C111.1 U2.11 U9.7
IN3P: C60.2 C74.2 U1.12 U5.8
IN3P2: C97.2 C111.2 U2.12 U9.8
IN4N: C63.2 C75.1 U1.9 U5.5
IN4N2: C100.2 C112.1 U2.9 U9.5
IN4P: C62.2 C75.2 U1.10 U5.6
IN4P2: C99.2 C112.2 U2.10 U9.6
IN5N: C65.2 C76.1 U1.7 U4.7
IN5N2: C102.2 C113.1 U2.7 U8.7
IN5P: C64.2 C76.2 U1.8 U4.8
IN5P2: C101.2 C113.2 U2.8 U8.8
IN6N: C67.2 C77.1 U1.5 U4.5
IN6N2: C104.2 C114.1 U2.5 U8.5
IN6P: C66.2 C77.2 U1.6 U4.6
IN6P2: C103.2 C114.2 U2.6 U8.6
IN7N: C69.2 C78.1 U1.3 U3.7
IN7N2: C106.2 C115.1 U2.3 U7.7
IN7P: C68.2 C78.2 U1.4 U3.8
IN7P2: C105.2 C115.2 U2.4 U7.8
IN8N: C71.2 C79.1 U1.1 U3.5
IN8N2: C108.2 C116.1 U2.1 U7.5
IN8P: C70.2 C79.2 U1.2 U3.6
IN8P2: C107.2 C116.2 U2.2 U7.6
POWERGOOD: LM1.1 ready1.1
PWDN#: FPC2.15 U1.35 U2.35
REF1: FPC1.1 FPC3.1 U1.17 U2.17
REF2: FPC1.2 FPC3.2 U1.18 U2.18
RESET#: FPC2.14 U1.36 U2.36
SCLK: FPC2.10 U1.40 U2.40
START: FPC2.12 U1.38 U2.38
WCT: FPC1.27 R35.2
WCT2: FPC3.27 R37.2
$1N19: C3.2 C4.2 U1.24
$1N24: C12.1 U1.26
$1N26: C13.1 U1.30
$1N44: C20.2 C21.2 U1.55
$1N307: C16.1 U2.30
$1N309: C15.1 U2.26
$1N319: C5.2 C34.2 U2.24
$1N323: C18.2 C19.2 U2.55
$1N350: C123.1 R35.1 U1.64
$1N353: C124.1 R37.1 U2.64
$1N354: C1.1 U1.28
$1N355: C2.1 U2.28
$1N379: C11.2 LM1.5
$1N387: C10.2 LM1.9
$1N388: C10.1 LM1.10
$1N399: R_pu1.2 ready1.2
$3N425: FPC3.25 U7.4
$3N426: FPC1.25 U3.4
$3N427: FPC3.13 U9.4
$3N428: FPC1.13 U5.4
$3N429: FPC3.10 U9.2
$3N430: FPC1.10 U5.2
$3N431: FPC3.9 U9.1
$3N432: FPC1.9 U5.1
$3N437: FPC3.15 U8.1
$3N438: FPC1.15 U4.1
$3N439: FPC3.24 U7.3
$3N440: FPC1.24 U3.3
$3N441: FPC3.22 U7.2
$3N442: FPC1.22 U3.2
$3N443: FPC3.21 U7.1
$3N444: FPC1.21 U3.1
$3N445: FPC3.19 U8.4
$3N446: FPC1.19 U4.4
$3N447: FPC3.18 U8.3
$3N448: FPC1.18 U4.3
$3N449: FPC3.16 U8.2
$3N450: FPC1.16 U4.2
$3N451: FPC3.12 U9.3
$3N452: FPC1.12 U5.3
$3N453: FPC3.7 U10.4
$3N454: FPC1.7 U6.4
$3N455: FPC3.6 U10.3
$3N456: FPC1.6 U6.3
$3N457: FPC3.4 U10.2
$3N458: FPC1.4 U6.2
$3N459: FPC3.3 U10.1
$3N460: FPC1.3 U6.1

Pads without a net: NOREF 23; NOREF#2 42; NOREF#3 27; NOREF#4 1; NOREF#5 1; NOREF#6 4; NOREF#7 17; NOREF#8 58; NOREF#9 51; NOREF#10 18; NOREF#11 25; NOREF#12 7; NOREF#13 1; NOREF#14 2; NOREF#15 27; NOREF#16 41; NOREF#17 9; NOREF#18 20; NOREF#19 2; NOREF#20 2; NOREF#21 2; NOREF#22 54; NOREF#23 31; NOREF#24 2; NOREF#25 57; NOREF#26 2; NOREF#27 12; NOREF#28 8; NOREF#29 25; NOREF#30 1; NOREF#31 6; NOREF#32 4; NOREF#33 3; NOREF#34 8; NOREF#35 1; NOREF#36 21; NOREF#37 45; NOREF#38 6; NOREF#39 2; NOREF#40 2; NOREF#41 2; NOREF#42 2; NOREF#43 53; NOREF#44 2; NOREF#45 1; NOREF#46 2; NOREF#47 16; NOREF#48 1; NOREF#49 5; NOREF#50 39; NOREF#51 17; NOREF#52 1; NOREF#53 3; NOREF#54 16; NOREF#55 2; NOREF#56 1; NOREF#57 29; NOREF#58 7; NOREF#59 2; NOREF#60 40; NOREF#61 4; NOREF#62 2; NOREF#63 1; NOREF#64 53; NOREF#65 14; NOREF#66 22; NOREF#67 1; NOREF#68 1; NOREF#69 6; NOREF#70 3; NOREF#71 1; NOREF#72 36; NOREF#73 2; NOREF#74 15; NOREF#75 37; NOREF#76 30; NOREF#77 4; NOREF#78 28; NOREF#79 19; NOREF#80 24; NOREF#81 1; NOREF#82 21; NOREF#83 43; NOREF#84 29; NOREF#85 46; NOREF#86 41; NOREF#87 5; NOREF#88 51; NOREF#89 2; NOREF#90 46; NOREF#91 1; NOREF#92 47; NOREF#93 2; NOREF#94 30; NOREF#95 21; NOREF#96 57; NOREF#97 3; NOREF#98 23; NOREF#99 40; NOREF#100 1; NOREF#101 11; NOREF#102 1; NOREF#103 18; NOREF#104 3; NOREF#105 62; NOREF#106 12; NOREF#107 5; NOREF#108 23; NOREF#109 1; NOREF#110 2; NOREF#111 2; NOREF#112 60; NOREF#113 19; NOREF#114 34; NOREF#115 24; NOREF#116 26; NOREF#117 15; NOREF#118 16; NOREF#119 19; NOREF#120 2; NOREF#121 1; NOREF#122 11; NOREF#123 10; NOREF#124 15; NOREF#125 1; NOREF#126 49; NOREF#127 2; NOREF#128 10; NOREF#129 1; NOREF#130 27; NOREF#131 1; NOREF#132 11; NOREF#133 38; NOREF#134 42; NOREF#135 9; NOREF#136 2; NOREF#137 54; NOREF#138 30; NOREF#139 13; NOREF#140 2; NOREF#141 17; NOREF#142 1; NOREF#143 2; NOREF#144 25; NOREF#145 21; NOREF#146 12; NOREF#147 23; NOREF#148 14; NOREF#149 14; NOREF#150 24; NOREF#151 32; NOREF#152 29; NOREF#153 52; NOREF#154 28; NOREF#155 18; NOREF#156 10; NOREF#157 38; NOREF#158 17; NOREF#159 55; NOREF#160 1; NOREF#161 28; NOREF#162 26; NOREF#163 1; NOREF#164 30; NOREF#165 62; NOREF#166 2; NOREF#167 33; NOREF#168 39; NOREF#169 29; NOREF#170 58; NOREF#171 8; NOREF#172 31; NOREF#173 45; NOREF#174 13; NOREF#175 12; NOREF#176 16; NOREF#177 9; NOREF#178 18; NOREF#179 27; NOREF#180 36; NOREF#181 26; NOREF#182 56; NOREF#183 8; NOREF#184 50; NOREF#185 2; NOREF#186 61; NOREF#187 28; NOREF#188 22; NOREF#189 1; NOREF#190 20; NOREF#191 14; NOREF#192 2; NOREF#193 2; NOREF#194 1; NOREF#195 61; NOREF#196 10; NOREF#197 44; NOREF#198 2; NOREF#199 25; NOREF#200 4; NOREF#201 19; NOREF#202 63; NOREF#203 7; NOREF#204 43; NOREF#205 47; NOREF#206 2; NOREF#207 1; NOREF#208 50; NOREF#209 60; NOREF#210 2; NOREF#211 24; NOREF#212 1; NOREF#213 44; NOREF#214 56; NOREF#215 55; NOREF#216 37; NOREF#217 35; NOREF#218 13; NOREF#219 1; NOREF#220 2; NOREF#221 11; NOREF#222 13; NOREF#223 2; NOREF#224 48; NOREF#225 9; NOREF#226 1; NOREF#227 52; NOREF#228 32; NOREF#229 1; NOREF#230 64; NOREF#231 63; NOREF#232 48; NOREF#233 22; NOREF#234 59; NOREF#235 2; NOREF#236 26; NOREF#237 31; NOREF#238 15; NOREF#239 32; NOREF#240 22; NOREF#241 20; NOREF#242 7; NOREF#243 59; NOREF#244 6; NOREF#245 2; NOREF#246 20; NOREF#247 1; NOREF#248 1; NOREF#249 32; NOREF#250 2; NOREF#251 33; NOREF#252 34; NOREF#253 31; NOREF#254 64; NOREF#255 35; NOREF#256 5; NOREF#257 1; NOREF#258 1; NOREF#259 1; NOREF#260 49; NOREF#261 2; NOREF#262 1; SCREW1 1; SCREW2 1; SCREW3 1; SCREW4 1; U1 27 29; U2 27 29

## Via types
v1: diameter 0.4, hole 0.3, Top Layer to Bottom Layer, 140 vias

## Routing (per net, layer and track width the routed paths; a pad name or vN(x,y) marks a point on that pad's centre or on a via; arc(x,y) is an arc through that point)
+2.5V: length 102.8
  Top Layer w0.152: U1.22 27.3,18.88 v1(27.02,18.61) 27.28,18.35 28.23,18.35 U1.21 30.13,18.38 C25.1 C24.1 ; C24.1 30.12,17.38 U1.19 ; C24.1 v1(30.16,16.19) ; 18.52,20.26 18.52,18.99 18.39,18.86 17.18,18.86 U1.59 14.89,18.88 C26.1 C27.1 13.78,18.44 13.57,18.23 13.32,18.23 13.32,18.23 v1(12.93,18.23) ; 18.52,20.26 18.52,21.15 18.28,21.38 U1.54 ; 18.52,20.26 18.39,20.38 U1.56 ; R6.2 15.29,27.55 15.19,27.65 LM1.11
  Top Layer w0.254: v1(12.93,18.23) 12.86,18.3 12.86,18.34 12.04,19.16 12.04,26.44 12.08,26.48 ; v1(30.16,16.19) 31.98,16.19 32.33,16.55 32.33,18.22 v1(31.85,18.69) ; v1(10.9,26.48) 12.08,26.48 ; 12.08,26.48 v1(13.44,26.48)
  Bottom Layer w0.152: C30.1 v1(14.74,15.94) ; C30.1 C31.1 15.45,17.72 15.98,18.25 ; C30.1 15.21,16.57 16.02,17.38 U2.19 ; U1.59 16.12,18.88 15.98,18.73 15.98,18.25 ; v1(31.85,18.69) 31.72,18.82 C33.1 C32.1 30.01,18.88 U1.22 27.3,18.88 27.13,18.71 ; U2.56 27.28,20.38 27.13,20.53 ; 27.13,20.53 27.13,21.27 27.25,21.4 28.24,21.4 U2.54 ; 27.13,20.53 27.11,20.51 27.11,18.73 27.13,18.71 ; 27.13,18.71 v1(27.02,18.61) ; 15.98,18.25 16.11,18.38 U2.21
  Bottom Layer w0.254: v1(14.74,15.94) 14.24,15.43 13.44,15.43 12.93,15.94 v1(12.93,18.23)
  Bottom Layer w0.381: v1(10.9,26.48) 10.64,26.73 10.64,33.47 11.12,33.94 28.25,33.94 32.49,29.7 32.49,19.33 v1(31.85,18.69)
+3.3V: length 65.3
  Top Layer w0.152: LM1.8 13.69,27.75 13.4,27.46 v1(13.35,27.46) ; v1(15.34,31.18) 15.21,31.05 14.87,31.05 ; v1(18.9,29.27) 18.84,29.33 R_pu1.1 ; C8.2 14.62,31.3 14.87,31.05 ; v1(16.1,28.06) 17.23,26.93 v1(19.02,26.93) ; C22.1 15.72,24.19 15.72,23.81 16.15,23.38 U1.50 ; 23.58,29.57 X1.4 24.25,30.78 C37.2 v1(24.27,32.2) ; 19.02,26.88 18.96,26.81 U1.48 ; 14.87,31.05 C9.1 14.69,30.98 LM1.3
  Top Layer w0.254: v1(30.2,24.58) 35.08,24.58 35.43,24.93 v1(35.43,25.56) ; LM1.12 v1(16.1,28.06)
  Bottom Layer w0.152: v1(18.9,29.27) 19.11,29.06 C23.1 19.11,26.96 19.02,26.88 ; 13.14,28.36 13.15,28.37
  Bottom Layer w0.203: U2.48 26.86,25.68 27.24,26.06 C28.1 v1(28.29,26.06) ; U2.50 29.26,23.38 29.6,23.73 C29.1 v1(30.2,24.58)
  Bottom Layer w0.254: v1(15.34,31.18) 16.1,30.42 v1(16.1,28.06) 16.74,27.43 16.74,25.33 v1(15.72,24.31) ; 15.33,31.17 14.49,31.17 13.14,29.81 13.14,27.61 13.29,27.46 v1(13.35,27.46)
  Bottom Layer w0.305: v1(15.34,31.18) 15.34,31.81 15.72,32.2 v1(16.99,32.2) v1(24.27,32.2) 27.41,32.2 28.29,31.31 v1(28.29,26.06)
  Bottom Layer w0.381: v1(30.2,24.58) 30.2,26.06 v1(28.29,26.06)
  vias: v1(34.83,25.18)
-2.5V: length 102.8
  Top Layer w0.152: U1.58 15.66,19.38 15.38,19.66 ; 27.19,19.38 v1(26.68,19.89) 27.17,20.38 U1.25 29.99,20.38 C4.1 ; 27.19,19.38 U1.23 ; 27.19,19.38 26.78,19.38 26.6,19.19 26.6,18.03 26.75,17.88 U1.20 ; C1.2 C13.2 v1(31.72,23.69) ; C1.2 v1(31.72,22.54) ; C1.2 C12.2 v1(31.72,21.4) ; v1(13.05,19.62) 13.09,19.66 C27.2 C26.2 15.38,19.66 ; 15.38,19.66 15.6,19.88 U1.57 ; v1(28.29,24.58) 28.26,24.54 U1.32 ; v1(13.05,21.69) C20.1 14.71,21.69 14.89,21.88 U1.53 ; v1(31.72,20.3) C3.1 30.2,20.3
  Top Layer w0.254: v1(31.72,25.21) 28.93,25.21 v1(28.29,24.58)
  Bottom Layer w0.152: v1(13.05,20.77) C15.2 C2.2 ; 18.28,19.5 18.26,19.5 18.15,19.38 U1.58 16.11,19.38 15.56,18.82 C34.1 C5.1 v1(13.05,18.82) ; 18.28,19.5 18.28,19.77 ; 18.28,19.5 18.28,20.23 18.13,20.38 U2.25 ; 18.28,19.5 18.28,18.12 18.04,17.88 U2.20 ; 29.53,19.66 29.31,19.88 U2.57 ; 29.53,19.66 29.24,19.38 U1.23 ; 29.53,19.66 C32.2 C33.2 v1(31.71,19.66) ; C2.2 13.27,21.91 v1(13.05,21.69) ; C2.2 C16.2 13.9,23.52 14.26,23.88 U2.32 ; U2.53 29.34,21.88 29.53,21.69 C18.1 C19.1 31.43,21.69 v1(31.72,21.4)
  Bottom Layer w0.254: v1(13.05,18.82) v1(13.05,19.62) v1(13.05,20.77) v1(13.05,21.69)
  Bottom Layer w0.381: v1(13.05,21.69) 13.05,21.85 11.66,23.25 v1(11.66,28.26) 11.66,32.99 12.12,33.46 28.05,33.46 31.72,29.78 v1(31.72,25.21) v1(31.72,23.69) v1(31.72,22.54) v1(31.72,21.4) v1(31.72,20.3) 31.72,19.67 v1(31.71,19.66)
AGND: length 86.8
  Top Layer w0.152: C25.2 31.47,18.35 v1(31.85,17.97) ; 10.11,28.78 10.17,28.84 10.69,28.84 ; 17.73,12.23 17.5,12 C70.1 ; 17.73,12.23 v1(17.75,12.26) ; 17.73,12.23 18.21,12.23 ; 17.73,12.23 17.72,12.23 17.69,12.25 ; v1(25.72,7.62) 25.69,7.59 FPC1.8 25.7,6.55 v1(25.7,5.4) ; v1(24.21,5.4) 24.21,6.54 FPC1.11 24.19,7.62 v1(24.19,7.62) ; v1(18.19,5.4) 18.19,5.41 FPC1.23 18.19,7.6 v1(18.18,7.62) ; v1(16.89,7.95) 16.69,7.76 FPC1.26 ; 19.95,12.35 v1(19.91,12.38) ; 19.95,12.35 19.67,12.35 19.44,12.12 ; 19.95,12.35 19.98,12.35 ; 19.95,12.35 20.04,12.26 C67.1 ; v1(15.72,5.4) 15.69,5.43 FPC1.28 15.68,6.57 v1(15.68,7.54) ; 12.8,32.23 13.51,32.23 13.53,32.25 13.78,32.25 13.78,30.71 14.19,30.3 LM1.4 14.19,29.28 14.44,29.03 v1(14.44,29) ; 28.33,12.5 28.66,12.5 28.82,12.66 28.82,12.95 28.82,12.96 ; U1.60 18.11,18.38 v1(18.64,17.84) 18.18,17.38 U1.62 ; C60.1 25.35,12.36 v1(25.37,12.38) 25.5,12.26 C59.1 ; v1(27.2,5.4) 27.19,5.4 FPC1.5 27.19,7.6 v1(27.22,7.62) ; C71.1 16.53,11.82 v1(16.53,13.02) ; 23.72,12.62 23.8,12.54 v1(23.8,12.13) ; 10.06,29.49 10.34,29.77 10.34,30.05 ; v1(19.67,7.62) 19.69,7.59 FPC1.20 19.69,5.44 v1(19.66,5.4) ; C58.1 26.52,12 v1(26.79,12.28) 27.04,12.53 C57.1 ; v1(22.7,5.4) 22.69,5.4 FPC1.14 22.69,7.6 v1(22.67,7.62) ; C123.2 v1(14.96,14.8) ; v1(14.71,5.4) 14.69,5.41 FPC1.30 v1(14.69,7.56) ; v1(21.21,7.62) 21.19,7.61 FPC1.17 21.19,5.44 v1(21.16,5.4) ; C24.2 31.6,17.34 v1(31.85,17.08) ; C64.1 22.54,12.91 22.81,12.64 22.81,11.74 C63.1 22.56,11.64 v1(22.45,11.75) ; C66.1 21.06,12.8 v1(21.21,12.95) 21.39,12.95 C65.1 ; R1.1 v1(10.9,20.13)
  Bottom Layer w0.152: 18.19,5.4 18.22,5.43 FPC3.5 18.22,7.58 18.19,7.61 ; 18.19,5.4 v1(18.19,5.4) ; 18.19,5.4 18.19,7.61 ; v1(29.7,5.4) 29.72,5.42 FPC3.28 ; 30.72,7.62 FPC3.30 30.72,5.42 v1(30.7,5.4) ; 18.26,12.26 v1(17.75,12.26) 17.5,12 C70.1 ; C59.1 25.5,12.26 v1(25.37,12.38) 25.35,12.4 C104.1 ; 23.72,12.62 23.8,12.54 v1(23.8,12.13) 23.8,11.82 23.72,11.75 ; v1(22.45,11.75) 22.56,11.64 C63.1 ; C71.1 16.48,12.97 v1(16.53,13.02) ; C57.1 27.04,12.53 v1(26.79,12.28) 26.52,12 C58.1 ; v1(13.9,15.94) C30.2 C31.2 ; FPC3.26 28.72,7.52 v1(28.55,7.68) ; 22.67,12.78 22.54,12.91 C64.1 ; 22.67,12.78 22.81,12.64 22.81,12.64 22.81,11.64 ; 22.67,12.78 22.58,12.78 ; v1(21.21,7.62) 21.22,7.61 FPC3.11 21.16,6.49 v1(21.16,5.4) ; v1(22.7,5.4) 22.72,5.42 FPC3.14 22.72,7.58 v1(22.67,7.62) ; 18.19,7.61 v1(18.18,7.62) ; U2.62 v1(26.9,17.38) 26.9,17.84 27.43,18.38 U2.60 ; v1(24.21,5.4) 24.22,5.41 FPC3.17 24.22,7.59 v1(24.19,7.62) ; 27.22,7.62 FPC3.23 27.22,5.42 v1(27.2,5.4) ; v1(25.7,5.4) 25.72,5.41 FPC3.20 25.72,7.62 v1(25.72,7.62) ; 19.69,5.43 v1(19.66,5.4) ; 19.69,5.43 19.69,7.6 ; 19.69,5.43 19.72,5.46 FPC3.8 19.72,7.57 19.69,7.6 ; v1(21.21,12.95) 21.06,12.8 C66.1 ; C67.1 20.04,12.26 v1(19.91,12.38) 19.66,12.38 ; 19.69,7.6 v1(19.67,7.62) ; C55.1 28.31,12.51 28.68,12.51 28.84,12.68 v1(28.84,12.99) C124.2 ; 19.64,12.38 C96.1
  vias: v1(10.1,29.53) v1(10.1,28.77) v1(11.4,4.46) v1(11.4,3.79) v1(11.4,3.03) v1(11.4,2.27) v1(11.56,20.77) v1(13.44,25.34) v1(13.63,29) v1(15.23,29) v1(29.31,4.51) v1(29.31,3.84) v1(29.31,3.08) v1(29.31,2.32) v1(30.72,7.62)
